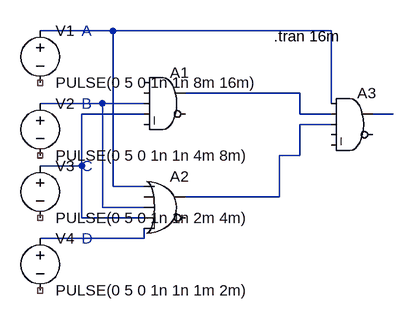
[diagram p0: schematic 11e.asc]
11e.asc, the LTspice schematic file:
Version 4.1
SHEET 1 880 680
WIRE 32 64 -80 64
WIRE 368 64 32 64
WIRE 320 160 144 160
WIRE 16 176 -80 176
WIRE 80 176 16 176
WIRE 368 176 368 64
WIRE 80 192 -16 192
WIRE 320 192 320 160
WIRE 368 192 320 192
WIRE 464 192 432 192
WIRE 368 208 320 208
WIRE 320 256 320 208
WIRE 320 256 288 256
WIRE -16 272 -16 192
WIRE -16 272 -80 272
WIRE 32 304 32 64
WIRE 80 304 32 304
WIRE 288 320 288 256
WIRE 288 320 144 320
WIRE 16 336 16 176
WIRE 80 336 16 336
WIRE -16 352 -16 272
WIRE 80 352 -16 352
WIRE 80 384 80 368
WIRE 80 384 -80 384
SYMBOL Digital\\and 112 112 R0
SYMATTR InstName A1
SYMBOL voltage -80 48 R0
WINDOW 123 0 0 Left 0
WINDOW 39 0 0 Left 0
SYMATTR InstName V1
SYMATTR Value PULSE(0 5 0 1n 1n 8m 16m)
SYMBOL voltage -80 160 R0
WINDOW 123 0 0 Left 0
WINDOW 39 0 0 Left 0
SYMATTR InstName V2
SYMATTR Value PULSE(0 5 0 1n 1n 4m 8m)
SYMBOL voltage -80 256 R0
WINDOW 123 0 0 Left 0
WINDOW 39 0 0 Left 0
SYMATTR InstName V3
SYMATTR Value PULSE(0 5 0 1n 1n 2m 4m)
SYMBOL voltage -80 368 R0
WINDOW 123 0 0 Left 0
WINDOW 39 0 0 Left 0
SYMATTR InstName V4
SYMATTR Value PULSE(0 5 0 1n 1n 1m 2m)
SYMBOL Digital\\or 112 272 R0
SYMATTR InstName A2
SYMBOL Digital\\and 400 144 R0
SYMATTR InstName A3
TEXT 280 72 Left 2 !.tran 16m
TEXT -16 64 Left 2 ;A
TEXT -16 176 Left 2 ;B
TEXT -16 272 Left 2 ;C
TEXT -16 384 Left 2 ;D

The netlist it stands for:
* 11e.asc
A1 0 0 N003 N004 0 0 N002 0 AND
V1 N001 NC_01 PULSE(0 5 0 1n 1n 8m 16m)
V2 N003 NC_02 PULSE(0 5 0 1n 1n 4m 8m)
V3 N004 NC_03 PULSE(0 5 0 1n 1n 2m 4m)
V4 N007 NC_04 PULSE(0 5 0 1n 1n 1m 2m)
A2 N001 0 N003 N004 N007 0 N006 0 OR
A3 N001 N002 N006 0 0 0 N005 0 AND
.tran 16m
* A
* B
* C
* D
.backanno
.end